# Altium project Control_Board.PrjPcb (part 2 of 2)

## Sheet Controller-Part-2.SchDoc
size A4; SheetNumber: 4
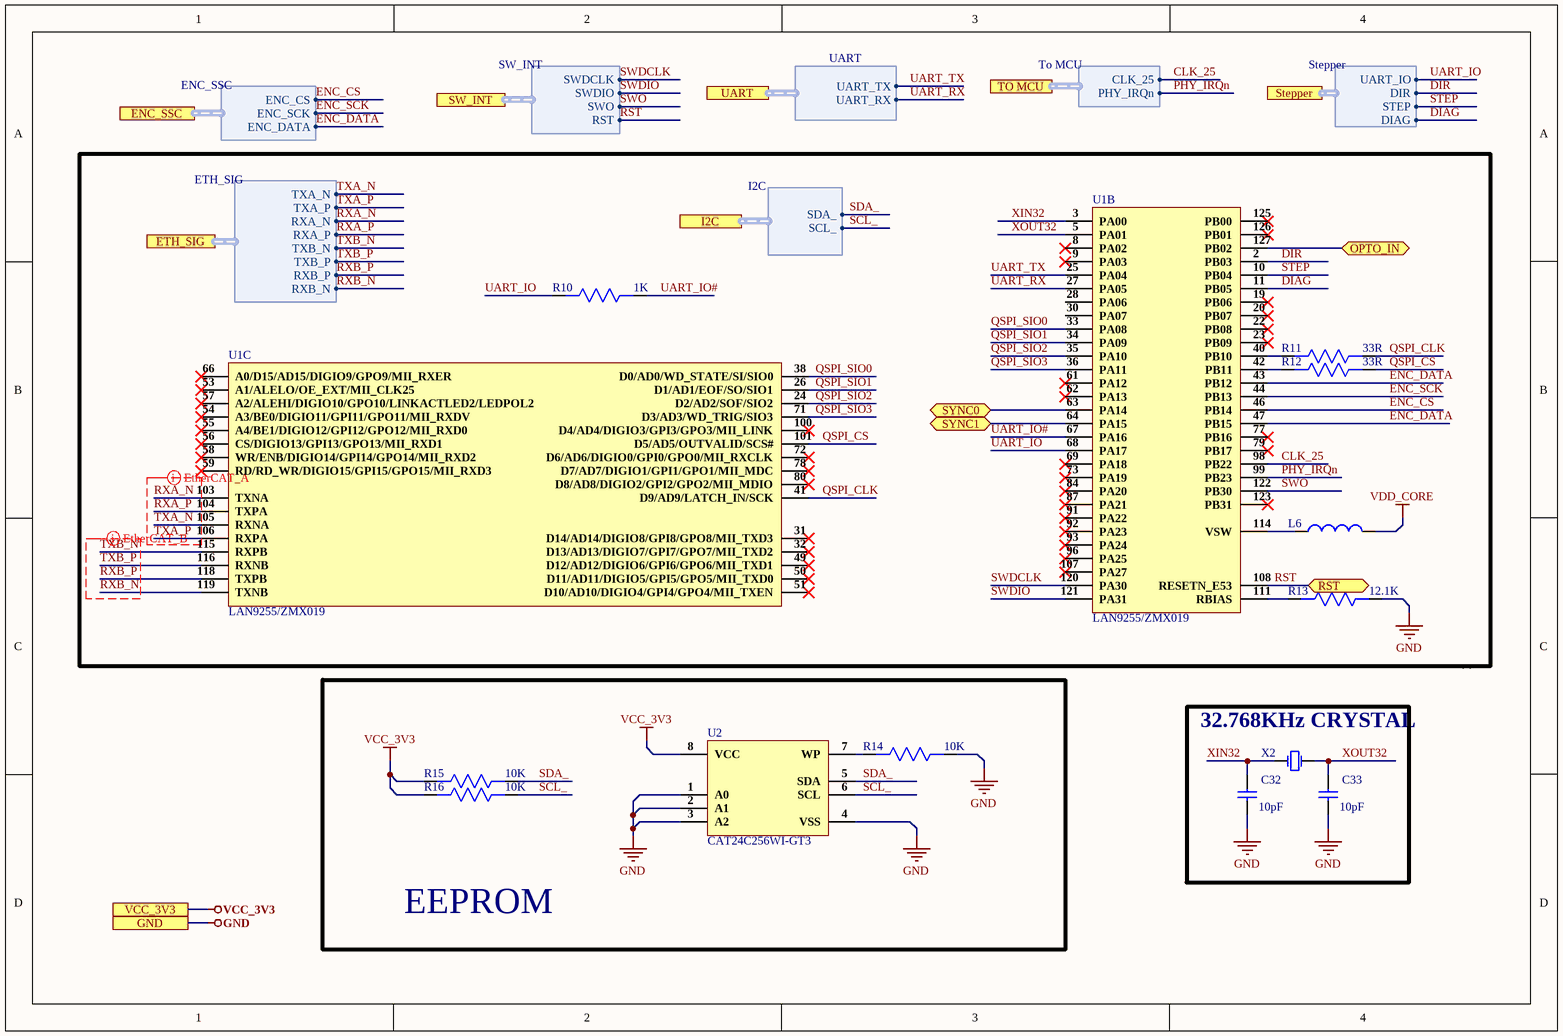
[diagram p5: Controller-Part-2.SchDoc]

### Parts
C32  10pF  [Cap0603]
C33  10pF  [Cap0603]
L6  MGFL2012F100MT-LF  [Ind0805]  (value not drawn)
R10  1K  [Res0603]
R11  33R  [Res0603]
R12  33R  [Res0603]
R13  12.1K  [Res0603]
R14  10K  [Res0603]
R15  10K  [Res0603]
R16  10K  [Res0603]
U1  LAN9255/ZMX019  [LAN9255/ZMX019]  (parts B,C of 3)
U2  CAT24C256WI-GT3  [CAT24C256WI-GT3]
X2  CM8V-T1A-32.768KHZ-6PF-20PPM-TA-QC  [CM8V-T1A-32.768KHZ-6PF-20PPM-TA-QC]  (value not drawn)

### Blocks framed on the sheet
EEPROM: R14-R16 U2
32.768KHz CRYSTAL: C32 C33 X2

### Ports
ENC_SSC (harness ENC_SSC), ETH_SIG (harness ETH_SIG), GND, I2C (harness I2C), OPTO_IN (bidir), RST (bidir), Stepper (harness Stepper), SW_INT (harness SW_INT), SYNC0 (bidir), SYNC1 (bidir), TO MCU (harness To MCU), UART (harness UART), VCC_3V3

### Harnesses
ENC_SSC: ENC_CS, ENC_SCK, ENC_DATA
SW_INT: SWDCLK, SWDIO, SWO, RST
ETH_SIG: TXA_N, TXA_P, RXA_N, RXA_P, TXB_N, TXB_P, RXB_P, RXB_N
To MCU: CLK_25, PHY_IRQn
Stepper: UART_IO, DIR, STEP, DIAG
UART: UART_TX, UART_RX
I2C: SDA_, SCL_

### Nets
GND: C32.1 C33.1 R13.1 R14.1 U2.1(A0) U2.2(A1) U2.3(A2) U2.4(VSS) ; port GND
VCC_3V3: R15.2 R16.2 U2.8(VCC) ; port VCC_3V3
VDD_CORE: L6.2
CLK_25: U1.98(PB22) ; port TO MCU.CLK_25
DIAG: U1.11(PB05) ; port Stepper.DIAG
DIR: U1.2(PB03) ; port Stepper.DIR
ENC_CS: U1.46(PB14) ; port ENC_SSC.ENC_CS
ENC_DATA: U1.43(PB12) U1.47(PB15) ; port ENC_SSC.ENC_DATA
ENC_SCK: U1.44(PB13) ; port ENC_SSC.ENC_SCK
OPTO_IN: U1.127(PB02) ; port OPTO_IN
PHY_IRQn: U1.99(PB23) ; port TO MCU.PHY_IRQn
QSPI_CLK: R11.1 U1.41(D9/AD9/LATCH_IN/SCK)
QSPI_CS: R12.1 U1.101(D5/AD5/OUTVALID/SCS#)
QSPI_SIO0: U1.33(PA08) U1.38(D0/AD0/WD_STATE/SI/SIO0)
QSPI_SIO1: U1.26(D1/AD1/EOF/SO/SIO1) U1.34(PA09)
QSPI_SIO2: U1.24(D2/AD2/SOF/SIO2) U1.35(PA10)
QSPI_SIO3: U1.36(PA11) U1.71(D3/AD3/WD_TRIG/SIO3)
RST: U1.108(RESETN_E53) ; port RST, port SW_INT.RST
RXA_N: U1.103(TXNA) ; port ETH_SIG.RXA_N
RXA_P: U1.104(TXPA) ; port ETH_SIG.RXA_P
RXB_N: U1.119(TXNB) ; port ETH_SIG.RXB_N
RXB_P: U1.118(TXPB) ; port ETH_SIG.RXB_P
SCL_: R16.1 U2.6(SCL) ; port I2C.SCL_
SDA_: R15.1 U2.5(SDA) ; port I2C.SDA_
STEP: U1.10(PB04) ; port Stepper.STEP
SWDCLK: U1.120(PA30) ; port SW_INT.SWDCLK
SWDIO: U1.121(PA31) ; port SW_INT.SWDIO
SWO: U1.122(PB30) ; port SW_INT.SWO
TXA_N: U1.105(RXNA) ; port ETH_SIG.TXA_N
TXA_P: U1.106(RXPA) ; port ETH_SIG.TXA_P
TXB_N: U1.115(RXPB) ; port ETH_SIG.TXB_N
TXB_P: U1.116(RXNB) ; port ETH_SIG.TXB_P
UART_IO: R10.2 U1.68(PA17) ; port Stepper.UART_IO
UART_IO#: R10.1 U1.67(PA16)
UART_RX: U1.27(PA05) ; port UART.UART_RX
UART_TX: U1.25(PA04) ; port UART.UART_TX
XIN32: C32.2 U1.3(PA00) X2.1(OSC1)
XOUT32: C33.2 U1.5(PA01) X2.2(OSC2)
NetL6_1: L6.1 U1.114(VSW)
NetR11_2: R11.2 U1.40(PB10)
NetR12_2: R12.2 U1.42(PB11)
NetR13_2: R13.2 U1.111(RBIAS)
NetR14_2: R14.2 U2.7(WP)
NetU1_39: U1.64(PA15) ; port SYNC1
NetU1_63: U1.63(PA14) ; port SYNC0

Not connected (* = marked no-connect by the designer): U1 8(PA02)* 9(PA03)* 19(PB06)* 20(PB07)* 22(PB08)* 23(PB09)* 28(PA06) 30(PA07) 31(D14/AD14/DIGIO8/GPI8/GPO8/MII_TXD3)* 32(D13/AD13/DIGIO7/GPI7/GPO7/MII_TXD2)* 49(D12/AD12/DIGIO6/GPI6/GPO6/MII_TXD1)* 50(D11/AD11/DIGIO5/GPI5/GPO5/MII_TXD0)* 51(D10/AD10/DIGIO4/GPI4/GPO4/MII_TXEN)* 53(A1/ALELO/OE_EXT/MII_CLK25)* 54(A3/BE0/DIGIO11/GPI11/GPO11/MII_RXDV)* 55(A4/BE1/DIGIO12/GPI12/GPO12/MII_RXD0)* 56(CS/DIGIO13/GPI13/GPO13/MII_RXD1)* 57(A2/ALEHI/DIGIO10/GPO10/LINKACTLED2/LEDPOL2)* 58(WR/ENB/DIGIO14/GPI14/GPO14/MII_RXD2)* 59(RD/RD_WR/DIGIO15/GPI15/GPO15/MII_RXD3)* 61(PA12)* 62(PA13)* 66(A0/D15/AD15/DIGIO9/GPO9/MII_RXER)* 69(PA18)* 72(D6/AD6/DIGIO0/GPI0/GPO0/MII_RXCLK)* 73(PA19)* 77(PB16)* 78(D7/AD7/DIGIO1/GPI1/GPO1/MII_MDC)* 79(PB17)* 80(D8/AD8/DIGIO2/GPI2/GPO2/MII_MDIO)* 84(PA20)* 87(PA21)* 91(PA22)* 92(PA23)* 93(PA24)* 96(PA25)* 100(D4/AD4/DIGIO3/GPI3/GPO3/MII_LINK)* 107(PA27)* 123(PB31)* 125(PB00)* 126(PB01)*

### Layout directives
differential pair; differential pair class EtherCAT_B_Lines; net class EtherCAT_B; rule Matched Net Lengths [Tolerance = 1000mil]; rule Impedance Constraint [Min = 90.00    Max = 110.0    ]: RXB_N, RXB_P, TXB_N, TXB_P
differential pair; differential pair class EtherCAT_A_Lines; net class EtherCAT_A; rule Matched Net Lengths [Tolerance = 1000mil]; rule Impedance Constraint [Min = 90.00    Max = 110.0    ]: RXA_N, RXA_P, TXA_N, TXA_P

### Library data of the parts
C32 C33 = 06035A100JAT2A: CAP CER 10PF 50V C0G/NP0 0603; Manufacturer: Kyocera AVX; Manufacturer Part Number: 06035A100JAT2A/4K; Tolerance: 5%; Dielectric: C0G; Temperature Coefficient: 30ppm/°C; Insulation Resistance: 100GR; Supplier 1: Digi-Key; Stock 1: 196463; Pricing 1: 1=0.1, 10=0.05, 50=0.0272, 100=0.0222, 500=0.01586, 1000=0.01246 (USD); Mount: Surface Mount; Case/Package: 0603; Number of Pins: 2; Min Operating Temperature: -55°C; Max Operating Temperature: 125°C; Capacitance: 10pF; Packaging: Cut Tape; Voltage Rating (DC): 50V; Voltage: 50V; Length: 1.6mm; Width: 810um; Height: 0.9mm; Depth: 0.81mm; Thickness: 864um; REACH SVHC: No SVHC; Lead Free: Lead Free; Supplier Part Number 1: 478-1163-1-ND
L6 = MGFL2012F100MT-LF: IND SMD 10uH 500mA 0805; Manufacturer: microgate; Tolerance: ±20%; DC Resistance (DCR): 320mΩ; Inductance: 10uH; Rated Current: 500mA
R10 = RC0603FR-071KL: RES SMD 1K OHM 1% 1/10W 0603; Manufacturer: Yageo; Resistance: 1kR; Temperature Coefficient: 100ppm/°C; Power Rating: 100mW; Voltage Rating: 50V; ComponentLink1URL: https://www.verical.com/server-webapp/html/getDatasheet?partID=409289&src-supplier=Verical; ComponentLink1Description: https://www.verical.com/server-webapp/html/getDatasheet?partID=409289&src-supplier=Verical; Supplier 1: Digi-Key; Manufacturer Part Number: RC0603FR-071KL; Stock 1: 21472395; Pricing 1: 1=0.1, 10=0.023, 100=0.0094, 1000=0.0042, 2500=0.0037 (USD); Case/Package: 0603; Contact Plating: Tin,Matte; Case Code (Imperial): 0603; Case Code (Metric): 1608; Min Operating Temperature: -55°C; Max Operating Temperature: 155°C; Tolerance: 1%; Composition: Thick Film; Packaging: Tape and Reel; Termination: SMD/SMT; Military Standard: Not; Length: 1.6mm; Height: 0.45mm; Depth: 0.8mm; Radiation Hardening: No; REACH SVHC: No SVHC; Lead Free: Lead Free; ComponentLink2URL: http://documents.rs-components.com/techlib://itc_doclist_GB.htm?stockno=5048928&src-supplier=RSComponents; ComponentLink2Description: http://documents.rs-components.com/techlib://itc_doclist_GB.htm?stockno=5048928&src-supplier=RSComponents; ComponentLink3URL: http://www.yageo.com/documents/recent/PYu-RC0603_51_RoHS_L_4.pdf?src-supplier=Avnet+Europe; ComponentLink3Description: http://www.yageo.com/documents/recent/PYu-RC0603_51_RoHS_L_4.pdf?src-supplier=Avnet+Europe; ComponentLink4URL: http://www.farnell.com/datasheets/2167052.pdf?src-supplier=Element14; ComponentLink4Description: http://www.farnell.com/datasheets/2167052.pdf?src-supplier=Element14; ComponentLink5URL: http://www.farnell.com/datasheets/1868787.pdf?src-supplier=Element14; ComponentLink5Description: http://www.farnell.com/datasheets/1868787.pdf?src-supplier=Element14; ComponentLink6URL: http://www.yageo.com/documents/recent/PYu-RC_Group_51_RoHS_L_2.pdf?src-supplier=Avnet; ComponentLink6Description: http://www.yageo.com/documents/recent/PYu-RC_Group_51_RoHS_L_2.pdf?src-supplier=Avnet; ComponentLink7URL: https://www.verical.com/server-webapp/html/getDatasheet?partID=404327&src-supplier=Verical; ComponentLink7Description: https://www.verical.com/server-webapp/html/getDatasheet?partID=404327&src-supplier=Verical; ComponentLink8URL: http://www.farnell.com/datasheets/443971.pdf?src-supplier=Element14; ComponentLink8Description: http://www.farnell.com/datasheets/443971.pdf?src-supplier=Element14; Supplier Part Number 1: 311-1.00KHRDKR-ND
R11 R12 = RC0603FR-0733RL: RES SMD 0603 33 Ohm 1% 1/10W; Manufacturer: Yageo; Temperature Coefficient: 100ppm/°C; Voltage Rating (DC): 50V; Power Rating: 100mW; Voltage Rating: 75V; Supplier 1: Digi-Key; Manufacturer Part Number: RC0603FR-0733RL; RoHS: Yes; Category: Chip SMD Resistors; Stock 1: 41; Pricing 1: 1=0.10000, 10=0.02400, 100=0.00970, 1000=0.00436, 2500=0.00378 (USD); Case/Package: 0603; Number of Pins: 2; Case Code (Metric): 1608; Case Code (Imperial): 0603; Weight: 7.1E-05oz; Size Code: 0603; Min Operating Temperature: -55°C; Max Operating Temperature: 155°C; Resistance: 33R; Tolerance: 1%; Resistor Type: Thick Film; Packaging: Tape and Reel; Package Quantity: 1; Number of Terminations: 2; Termination: SMD/SMT; Max Power Dissipation: 100mW; Features: Moisture Resistant; Series: RC; Resistance Tolerance: 1%; Technology: THICK FILM; Construction: Rectangular; Length: 1.6mm; Width: 0.8mm; Height: 0.45mm; Depth: 0.8mm; Lead Pitch: 0.3mm; REACH SVHC: No SVHC; Lead Free: Lead Free; Military Standard: Not; RoHS Compliant: Yes; ComponentLink1URL: https://datasheet.ciiva.com/11808/0900766b80f96399-11808741.pdf?src-supplier=RSComponents; ComponentLink1Description: https://datasheet.ciiva.com/11808/0900766b80f96399-11808741.pdf?src-supplier=RSComponents; ComponentLink2URL: https://datasheet.ciiva.com/2453/pyu-r-int-thick-7-2453952.pdf?src-supplier=Digi-Key; ComponentLink2Description: https://datasheet.ciiva.com/2453/pyu-r-int-thick-7-2453952.pdf?src-supplier=Digi-Key; ComponentLink3URL: https://datasheet.ciiva.com/2453/pyu-r-int-thick-7-2453953.pdf?src-supplier=Digi-Key; ComponentLink3Description: https://datasheet.ciiva.com/2453/pyu-r-int-thick-7-2453953.pdf?src-supplier=Digi-Key; ComponentLink4URL: https://datasheet.ciiva.com/2453/pyu-r-int-thick-7-2453954.pdf?src-supplier=Digi-Key; ComponentLink4Description: https://datasheet.ciiva.com/2453/pyu-r-int-thick-7-2453954.pdf?src-supplier=Digi-Key; ComponentLink5URL: https://datasheet.ciiva.com/7660/38590-7660792.pdf?src-supplier=Element14; ComponentLink5Description: https://datasheet.ciiva.com/7660/38590-7660792.pdf?src-supplier=Element14; ComponentLink6URL: https://datasheet.ciiva.com/15189/getdatasheetpartid-326673-15189708.pdf?src-supplier=Verical; ComponentLink6Description: https://datasheet.ciiva.com/15189/getdatasheetpartid-326673-15189708.pdf?src-supplier=Verical; ComponentLink7URL: https://datasheet.ciiva.com/7746/443971-7746334.pdf?src-supplier=Element14; ComponentLink7Description: https://datasheet.ciiva.com/7746/443971-7746334.pdf?src-supplier=Element14; ComponentLink8URL: https://datasheet.ciiva.com/7746/443971-7746335.pdf?src-supplier=Element14; ComponentLink8Description: https://datasheet.ciiva.com/7746/443971-7746335.pdf?src-supplier=Element14; ComponentLink9URL: https://datasheet.ciiva.com/46395/443971-46395007.pdf?src-supplier=Element14; ComponentLink9Description: https://datasheet.ciiva.com/46395/443971-46395007.pdf?src-supplier=Element14; Supplier Part Number 1: 311-33.0HRCT-ND
R13 = RT0603CRD0712K1L: RES SMD 12.1K OHM 1/10W 0603; Manufacturer: Yageo; Resistance: 12.1kR; Tolerance: 0.25%; Temperature Coefficient: 25ppm/°C; Power Rating: 100mW; Voltage Rating: 75V; Voltage Rating (DC): 50V; Supplier 1: Digi-Key; Manufacturer Part Number: RT0603CRD0712K1L; RoHS: Yes; Category: Chip SMD Resistors; Pricing 1: 5000=0.06299 (USD); Case/Package: 0603; Contact Plating: Tin,Matte; Case Code (Metric): 1608; Case Code (Imperial): 0603; Min Operating Temperature: -55°C; Max Operating Temperature: 125°C; Resistor Type: Thin Film; Package Quantity: 5000; Packaging: Tape and Reel; Number of Terminations: 2; Termination: SMD/SMT; Max Power Dissipation: 100mW; Series: RT; Length: 0.063inch; Width: 0.031inch; Height: 0.022inch; Radiation Hardening: No; Lead Free: Lead Free; RoHS Compliant: Yes; ComponentLink1URL: https://datasheet.ciiva.com/2590/pyu-rt-1-to-0-05-rohs-l-5-2590806.pdf?src-supplier=Digi-Key; ComponentLink1Description: https://datasheet.ciiva.com/2590/pyu-rt-1-to-0-05-rohs-l-5-2590806.pdf?src-supplier=Digi-Key; ComponentLink2URL: https://datasheet.ciiva.com/8891/pyu-rt-1-to-0-05-rohs-l-4-8891049.pdf?src-supplier=Avnet; ComponentLink2Description: https://datasheet.ciiva.com/8891/pyu-rt-1-to-0-05-rohs-l-4-8891049.pdf?src-supplier=Avnet; ComponentLink3URL: https://datasheet.ciiva.com/12721/pyu-rt-1-to-0-05-rohs-l-4-12721018.pdf?src-supplier=Mouser; ComponentLink3Description: https://datasheet.ciiva.com/12721/pyu-rt-1-to-0-05-rohs-l-4-12721018.pdf?src-supplier=Mouser; Supplier Part Number 1: RT0603CRD0712K1L-ND
R14-R16 = AC0603JR-0710KL: RES SMD 10K OHM 5% 1/10W 0603; Manufacturer: Yageo; Voltage Rating: 50V; Resistance: 10kR; Power Rating: 100mW; Temperature Coefficient: 100ppm/°C; Supplier 1: Future Electronics; Manufacturer Part Number: AC0603JR-0710KL; RoHS: Yes; Category: Chip SMD Resistors; Stock 1: 1533000; Pricing 1: 5000=0.00540 (USD); Case/Package: 0603; Case Code (Imperial): 0603; Case Code (Metric): 1608; Size Code: 0603; Min Operating Temperature: -55°C; Max Operating Temperature: 155°C; Packaging: Tape and Reel; Tolerance: 5%; Package Quantity: 1; Resistor Type: Thick Film; Termination: SMD/SMT; Number of Terminations: 2; Max Power Dissipation: 100mW; Features: Moisture Resistant,Automotive AEC-Q200,Anti-Sulfur; Series: AC; Construction: Rectangular; Length: 0.063inch; Width: 0.031inch; Height: 0.022inch; Depth: 0.8mm; Military Standard: Not; Lead Free: Lead Free; RoHS Compliant: Yes; ComponentLink1URL: https://datasheet.ciiva.com/5562/pyu-ac-51-rohs-l-2-5562553.pdf?src-supplier=Mouser; ComponentLink1Description: https://datasheet.ciiva.com/5562/pyu-ac-51-rohs-l-2-5562553.pdf?src-supplier=Mouser; Supplier Part Number 1: 1029044
U1 = LAN9255/ZMX019: IC ETHERCAT SLAVE CONTROLLER; Manufacturer: Microchip; Manufacturer Part Number: LAN9255-I/ZMX019; Supplier 1: Digi-Key; Stock 1: 70; Pricing 1: 1=17.76000, 25=16.18480 (USD); Supplier Part Number 1: 150-LAN9255-I/ZMX019-ND
U2 = CAT24C256WI-GT3: IC EEPROM 256KBIT I2C 1MHZ 8SOIC; Manufacturer: ON Semiconductor; Interface: I2C,Serial,2-Wire; Access Time: 900ns; Max Supply Voltage: 5.5V; Min Supply Voltage: 1.8V; Frequency: 400kHz; Memory Size: 256Kb; Number of Words: 32000; Operating Supply Voltage: 5V; Nominal Supply Current: 3mA; Write Cycle Time-Max (tWC): 5ms; Write Protection: YES; Organization: 32KX8; Supplier 1: RSComponents; Manufacturer Part Number: CAT24C256WI-GT3; RoHS: Yes; Category: EEPROM; Stock 1: 300; Pricing 1: 100=0.19900, 200=0.19400, 500=0.18900, 1000=0.18400 (GBP); Mount: Surface Mount; Case/Package: SOIC; Number of Pins: 8; Contact Plating: Gold; Min Operating Temperature: -40°C; Max Operating Temperature: 85°C; Packaging: Tape and Reel; Density: 256Kb; Package Quantity: 1; Memory Type: EEPROM; Max Frequency: 400kHz; Series: -; Supply Voltage-Nom: 5.5V; Access Time-Max: 900ns; Supply Current: 3mA; Length: 5mm; Width: 4mm; Height: 1.5mm; Radiation Hardening: No; Lead Free: Lead Free; Halogen Free: Halogen Free; REACH SVHC: No SVHC; RoHS Compliant: Yes; ComponentLink1URL: https://datasheet.ciiva.com/8072/1780696-8072142.pdf?src-supplier=Element14; ComponentLink1Description: https://datasheet.ciiva.com/8072/1780696-8072142.pdf?src-supplier=Element14; ComponentLink2URL: https://datasheet.ciiva.com/46391/1792913-46391371.pdf?src-supplier=Element14; ComponentLink2Description: https://datasheet.ciiva.com/46391/1792913-46391371.pdf?src-supplier=Element14; ComponentLink3URL: https://datasheet.ciiva.com/4859/cat24c256-d-105771-4859816.pdf?src-supplier=Mouser; ComponentLink3Description: https://datasheet.ciiva.com/4859/cat24c256-d-105771-4859816.pdf?src-supplier=Mouser; ComponentLink4URL: https://datasheet.ciiva.com/16427/cat24c256-d-16427973.pdf?src-supplier=Future+Electronics; ComponentLink4Description: https://datasheet.ciiva.com/16427/cat24c256-d-16427973.pdf?src-supplier=Future+Electronics; Supplier Part Number 1: 8080199P
X2 = CM8V-T1A-32.768KHZ-6PF-20PPM-TA-QC: Crystal 32.768KHZ 6.0PF SMD; Manufacturer: Micro Crystal; Supplier 1: Digi-Key; Manufacturer Part Number: CM8V-T1A-32.768KHZ-6PF-20PPM-TA-QC; RoHS: No; Stock 1: 21000; Pricing 1: 1=0.68000, 10=0.56400, 50=0.50740, 100=0.45100, 500=0.42844 (USD); Supplier Part Number 1: 2195-CM8V-T1A-32.768KHZ-6PF-20PPM-TA-QCCT-ND

## Sheet Encoder-Section.SchDoc
size A4; SheetNumber: 5
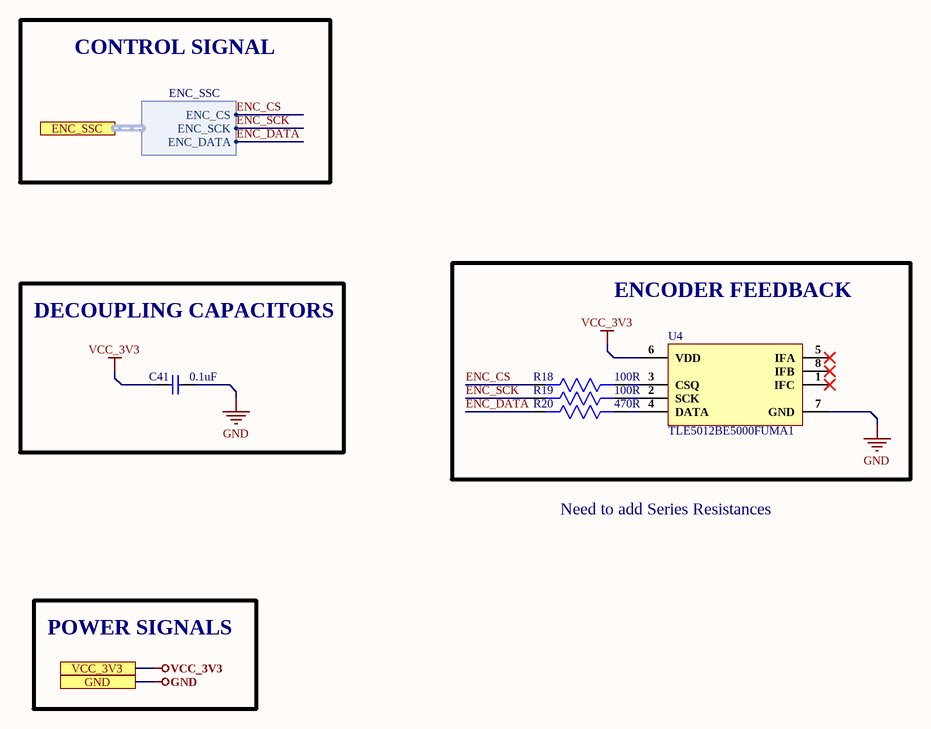
[diagram p6: Encoder-Section.SchDoc]

### Parts
C41  0.1uF  [Cap0603]
R18  100R  [Res0603]
R19  100R  [Res0603]
R20  470R  [Res0603]
U4  TLE5012BE5000FUMA1  [TLE5012BE5000FUMA1]

### Blocks framed on the sheet
DECOUPLING CAPACITORS: C41
ENCODER FEEDBACK: R18-R20 U4

### Ports
ENC_SSC (harness ENC_SSC), GND, VCC_3V3

### Harnesses
ENC_SSC: ENC_CS, ENC_SCK, ENC_DATA

### Nets
GND: C41.2 U4.7(GND) ; port GND
VCC_3V3: C41.1 U4.6(VDD) ; port VCC_3V3
ENC_CS: R18.2 ; port ENC_SSC.ENC_CS
ENC_DATA: R20.2 ; port ENC_SSC.ENC_DATA
ENC_SCK: R19.2 ; port ENC_SSC.ENC_SCK
NetR18_1: R18.1 U4.3(CSQ)
NetR19_1: R19.1 U4.2(SCK)
NetR20_1: R20.1 U4.4(DATA)

Not connected (* = marked no-connect by the designer): U4 1(IFC)* 5(IFA)* 8(IFB)*

### Notes on the sheet
- CONTROL SIGNAL
- Need to add Series Resistances
- POWER SIGNALS

### Library data of the parts
C41 = CC0603KRX7R0BB104: CAP CER 0.1UF 100V X7R 0603; Manufacturer: Yageo; Capacitance: 100nF; Tolerance: 10%; Supplier 1: Digi-Key; Manufacturer Part Number: CC0603KRX7R0BB104; RoHS: Yes; Category: Ceramic Capacitors; Stock 1: 60476; Pricing 1: 1=0.19000, 10=0.13500, 50=0.07680, 100=0.06370, 500=0.04466, 1000=0.03696 (USD); Mount: Surface Mount; Case/Package: 0603; Case Code (Metric): 1608; Case Code (Imperial): 0603; Weight: 7.1E-05oz; Min Operating Temperature: -55°C; Max Operating Temperature: 125°C; Package Quantity: 4000; Voltage Rating: 100V; Packaging: Tape and Reel; Dielectric: X7R; Termination: SMD/SMT; Resistor Type: Ceramic; Voltage Rating (DC): 100V; Series: CC; Length: 0.063inch; Width: 0.031inch; Thickness: 0.035inch; Depth: 0.8mm; Lead Free: Lead Free; RoHS Compliant: Yes; ComponentLink1URL: https://datasheet.ciiva.com/6277/mlccorderingcode-6277030.pdf?src-supplier=Digi-Key; ComponentLink1Description: https://datasheet.ciiva.com/6277/mlccorderingcode-6277030.pdf?src-supplier=Digi-Key; ComponentLink2URL: https://datasheet.ciiva.com/6277/mlccorderingcode-6277081.pdf?src-supplier=Digi-Key; ComponentLink2Description: https://datasheet.ciiva.com/6277/mlccorderingcode-6277081.pdf?src-supplier=Digi-Key; ComponentLink3URL: https://datasheet.ciiva.com/6277/mlccorderingcode-6277082.pdf?src-supplier=Digi-Key; ComponentLink3Description: https://datasheet.ciiva.com/6277/mlccorderingcode-6277082.pdf?src-supplier=Digi-Key; Supplier Part Number 1: 311-1523-1-ND
R18 R19 = RC0603FR-07100RL: RES SMD 100 OHM 1% 1/10W 0603; Manufacturer: Yageo; Temperature Coefficient: 100ppm/°C; Voltage Rating (DC): 50V; Power Rating: 100mW; Supplier 1: Arrow Electronics; Manufacturer Part Number: RC0603FR-07100RL; RoHS: Yes; Category: Chip SMD Resistors; Stock 1: 3800000; Pricing 1: 5000=0.00300, 5000=0.00200, 5000=0.00450, 50000=0.00410, 500000=0.00230, 2500000=0.00140 (USD); Case/Package: 0603; Number of Pins: 2; Case Code (Imperial): 0603; Case Code (Metric): 1608; Size Code: 0603; Min Operating Temperature: -55°C; Max Operating Temperature: 155°C; Resistance: 100R; Tolerance: 1%; Resistor Type: Thick Film; Packaging: Tape and Reel; Voltage Rating: 50V; Termination: SMD/SMT; Features: Moisture Resistant; Series: RC; Max Power Dissipation: 100mW; Number of Terminations: 2; Construction: Rectangular; Resistance Tolerance: 1%; Technology: THICK FILM; Length: 1.6mm; Width: 0.8mm; Height: 0.45mm; Depth: 0.8mm; REACH SVHC: Unknown; Lead Free: Lead Free; RoHS Compliant: Yes; Military Standard: Not; Supplier Part Number 1: RC0603FR-07100RL
R20 = RC0603FR-07470RL: RES SMD 470 OHM 1% 1/10W 0603; Manufacturer: Yageo; Power Rating: 100mW; Voltage Rating: 50V; Temperature Coefficient: 100ppm/°C; Working Voltage: 75V; Supplier 1: Digi-Key; Manufacturer Part Number: RC0603FR-07470RL; Stock 1: 4530601; Pricing 1: 1=0.1, 10=0.023, 100=0.0094, 1000=0.00421, 2500=0.00366 (USD); Case/Package: 0603; Case Code (Metric): 1608; Case Code (Imperial): 0603; Min Operating Temperature: -55°C; Max Operating Temperature: 155°C; Tolerance: 1%; Resistance: 470R; Packaging: Tape and Reel; Package Quantity: 1; Composition: Thick Film; Number of Terminations: 2; Termination: SMD/SMT; Military Standard: Not; Max Power Dissipation: 100mW; Features: Moisture Resistant; Length: 1.6mm; Height: 0.022inch; Width: 0.031inch; Depth: 0.8mm; REACH SVHC: No SVHC; Lead Free: Lead Free; ComponentLink1URL: http://documents.rs-components.com/techlib://itc_doclist_GB.htm?stockno=5047341&src-supplier=RSComponents; ComponentLink1Description: http://documents.rs-components.com/techlib://itc_doclist_GB.htm?stockno=5047341&src-supplier=RSComponents; ComponentLink2URL: http://www.farnell.com/datasheets/1868787.pdf?src-supplier=Element14; ComponentLink2Description: http://www.farnell.com/datasheets/1868787.pdf?src-supplier=Element14; ComponentLink3URL: http://www.farnell.com/datasheets/2167052.pdf?src-supplier=Element14; ComponentLink3Description: http://www.farnell.com/datasheets/2167052.pdf?src-supplier=Element14; ComponentLink4URL: http://www.yageo.com/documents/recent/PYu-RC_Group_51_RoHS_L_10.pdf?src-supplier=Digi-Key; ComponentLink4Description: http://www.yageo.com/documents/recent/PYu-RC_Group_51_RoHS_L_10.pdf?src-supplier=Digi-Key; Supplier Part Number 1: 311-470HRCT-ND
U4 = TLE5012BE5000FUMA1: MAGNETIC ANGLE SENSOR; Manufacturer: Infineon; Interface: SPI,PWM; Supplier 1: RSComponents; Manufacturer Part Number: TLE5012BE5000; RoHS: Yes; Category: Magnetic Sensors; Number of Pins: 8; Series: TLE5012; Package Quantity: 2500; Packaging: Tape and Reel; RoHS Compliant: Yes; ComponentLink1URL: http://www.mouser.com/ds/2/196/Infineon-TLE5012B_Exxxx-DS-v02_00-en-540142.pdf?src-supplier=Mouser; ComponentLink1Description: http://www.mouser.com/ds/2/196/Infineon-TLE5012B_Exxxx-DS-v02_00-en-540142.pdf?src-supplier=Mouser; Supplier Part Number 1: 2238590

## Nets that join several sheets
GND: Connector-Section (5 pins), Level-Shifter-Section (C34.2 C35.2 U3.2), Controller-Part-1 (41 pins), Controller-Part-2 (8 pins), Encoder-Section (C41.2 U4.7)
VCC_3V3: Connector-Section (6 pins), Level-Shifter-Section (C34.1 R23.1 U3.3), Controller-Part-1 (34 pins), Controller-Part-2 (R15.2 R16.2 U2.8), Encoder-Section (C41.1 U4.6)
VDD_5V: Connector-Section (J3.21), Level-Shifter-Section (C35.1 U3.7)
VDD_CORE: Controller-Part-1 (C29.1 C30.1 U1.109), Controller-Part-2 (L6.2)
VDDTXRX1: Connector-Section (J3.1 J3.3), Controller-Part-1 (C3.1 C4.1 L1.2 U1.102)
VDDTXRX2: Connector-Section (J3.5 J3.7), Controller-Part-1 (C5.1 C6.1 L2.2 U1.124)
#UART_RX: Connector-Section (J3.26), Level-Shifter-Section (U3.1)
#UART_TX: Connector-Section (J3.24), Level-Shifter-Section (U3.8)
CLK_25: Controller-Part-1 (R6.1), Controller-Part-2 (U1.98)
DIAG: Connector-Section (J3.19), Controller-Part-2 (U1.11)
DIR: Connector-Section (J3.20), Controller-Part-2 (U1.2)
ENC_CS: Controller-Part-2 (U1.46), Encoder-Section (R18.2)
ENC_DATA: Controller-Part-2 (U1.43 U1.47), Encoder-Section (R20.2)
ENC_SCK: Controller-Part-2 (U1.44), Encoder-Section (R19.2)
LINK0: Connector-Section (J3.16 SB7.1), Controller-Part-1 (R4.2 U1.95)
LINK1: Connector-Section (J3.17 SB6.1), Controller-Part-1 (R3.2 U1.90)
NetU1_39: Controller-Part-1 (U1.39), Controller-Part-2 (U1.64)
NetU1_63: Controller-Part-1 (U1.70), Controller-Part-2 (U1.63)
OPTO_IN: Connector-Section (J3.6), Controller-Part-2 (U1.127)
PHY_IRQn: Controller-Part-1 (R42.2 U1.88), Controller-Part-2 (U1.99)
RST: Connector-Section (J2.5), Controller-Part-1 (C31.1 R9.1 SW1.1 U1.21), Controller-Part-2 (U1.108)
RXA_N: Connector-Section (J3.14), Controller-Part-2 (U1.103)
RXA_P: Connector-Section (J3.12), Controller-Part-2 (U1.104)
RXB_N: Connector-Section (J3.15), Controller-Part-2 (U1.119)
RXB_P: Connector-Section (J3.13), Controller-Part-2 (U1.118)
SCL_: Connector-Section (SB5.1), Controller-Part-1 (U1.83), Controller-Part-2 (R16.1 U2.6)
SDA_: Connector-Section (SB4.1), Controller-Part-1 (U1.82), Controller-Part-2 (R15.1 U2.5)
STEP: Connector-Section (J3.22), Controller-Part-2 (U1.10)
SWDCLK: Connector-Section (J2.3 R40.2), Controller-Part-2 (U1.120)
SWDIO: Connector-Section (J2.2), Controller-Part-2 (U1.121)
SWO: Connector-Section (J2.4), Controller-Part-2 (U1.122)
TXA_N: Connector-Section (J3.10), Controller-Part-2 (U1.105)
TXA_P: Connector-Section (J3.8), Controller-Part-2 (U1.106)
TXB_N: Connector-Section (J3.11), Controller-Part-2 (U1.115)
TXB_P: Connector-Section (J3.9), Controller-Part-2 (U1.116)
UART_IO: Connector-Section (J3.18), Controller-Part-2 (R10.2 U1.68)
UART_RX: Level-Shifter-Section (U3.4), Controller-Part-2 (U1.27)
UART_TX: Level-Shifter-Section (U3.5), Controller-Part-2 (U1.25)